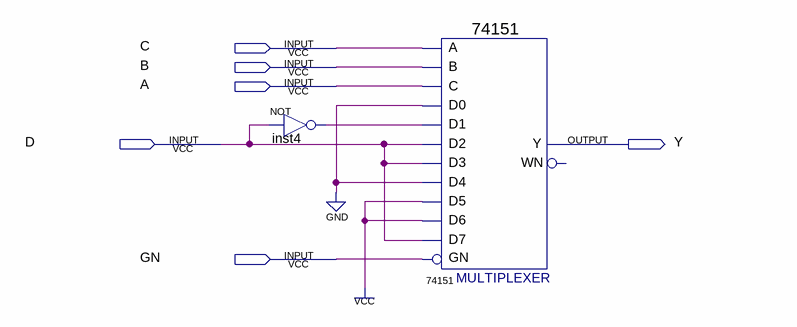
[diagram p0: schematic sheet]
// Quartus schematic 74151_test.bdf as structural Verilog: 2 symbols, 6 pins
module \74151_test  (
  input  C,
  input  B,
  input  A,
  input  D,
  input  GN,
  output Y
);

  wire inst4_out;

  not inst4 (inst4_out, D);
  \74151  u_74151 (
    .GN(GN), .C(A), .B(B), .A(C), .D5(1'b1), .D0(1'b0), .D1(inst4_out), .D4(1'b0), .D3(D), .D2(D), .D6(1'b1),
    .D7(D), .Y(Y));  // open: WN
endmodule
